# Altium schematic sheet Alimentation.SchDoc
size A4; SheetNumber: 2; SheetTotal: 5
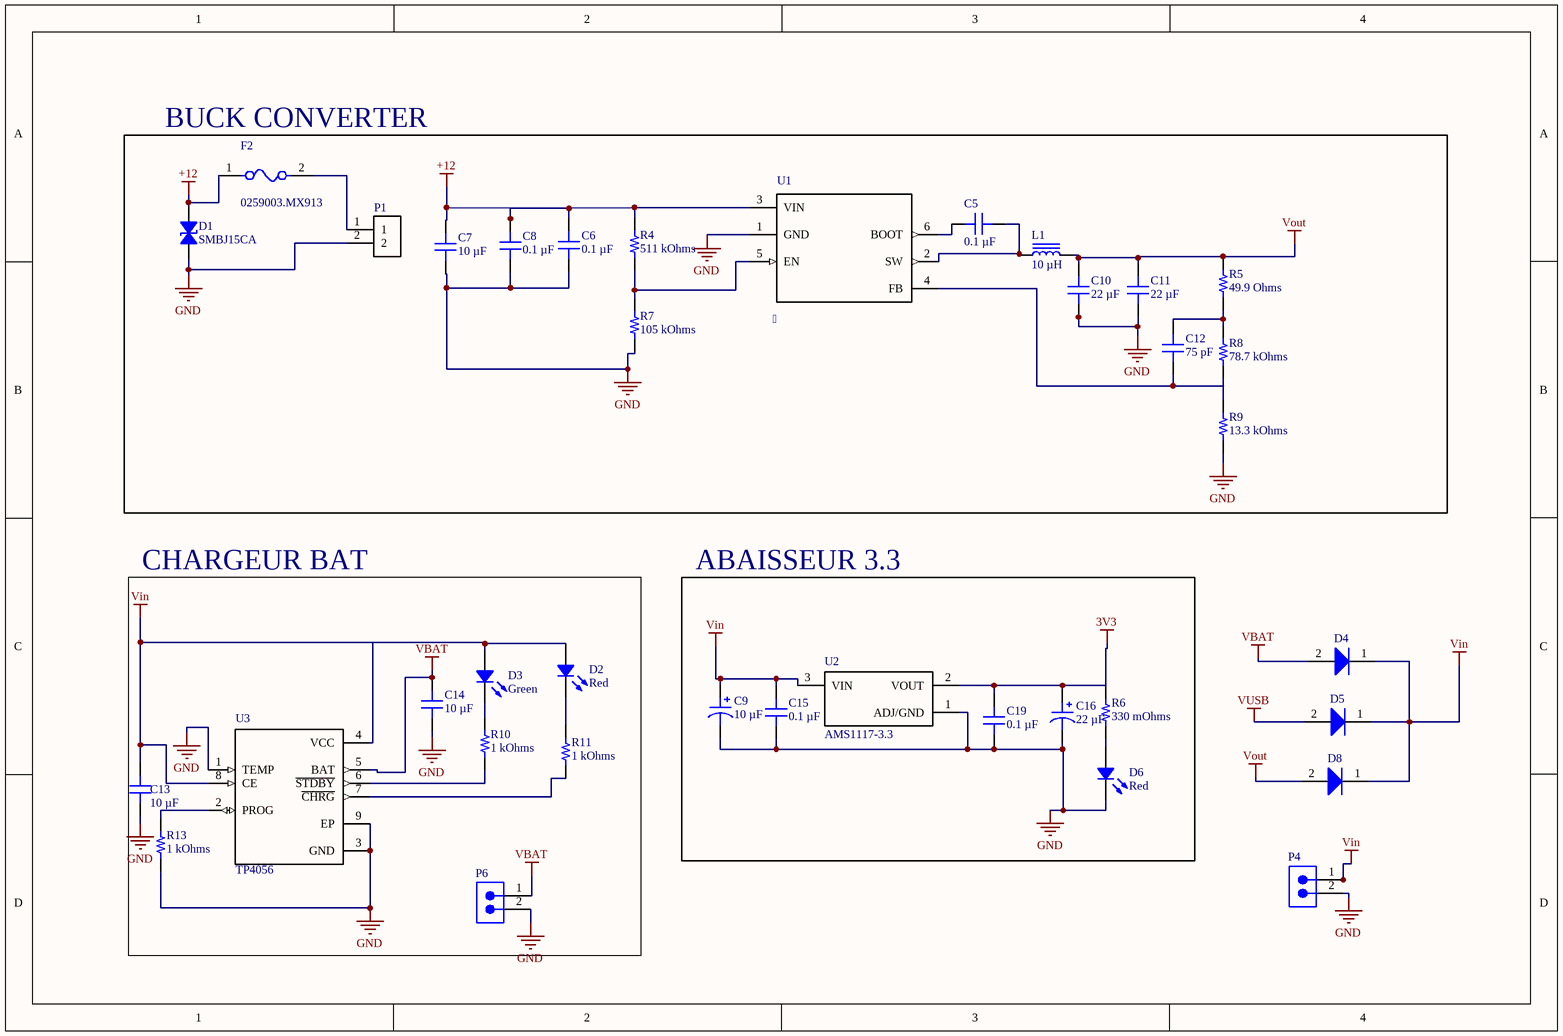
[diagram p0: Alimentation.SchDoc]

## Parts
C5  0.1 µF  [CAP 0402_1005]
C6  0.1 µF  [CAP 0402_1005]
C7  10 µF  [CAP 0805_2012]
C8  0.1 µF  [CAP 0402_1005]
C9  10 µF  [CAP ALSMD 4.3MM H5.4MM]
C10  22 µF  [CAP 0805_2012]
C11  22 µF  [CAP 0805_2012]
C12  75 pF  [CAP 0402_1005]
C13  10 µF  [CAP 0805_2012]
C14  10 µF  [CAP 0805_2012]
C15  0.1 µF  [CAP 0402_1005]
C16  22 µF  [CAP ALSMD 4.3MM H5.4MM]
C19  0.1 µF  [CAP 0402_1005]
D1  SMBJ15CA  [DO214AA SMB]
D2  Red  [LED 1206_3216 RED]
D3  Green  [LED 1206_3216 GREEN]
D4  NSR0320MW2T1G  [ONSC-SOD-323-2-477-02_V]  (value not drawn)
D5  NSR0320MW2T1G  [ONSC-SOD-323-2-477-02_V]  (value not drawn)
D6  Red  [LED 1206_3216 RED]
D8  NSR0320MW2T1G  [ONSC-SOD-323-2-477-02_V]  (value not drawn)
F2  0259003.MX913  [FP-0259-MFG]
L1  10 µH  [TDK VLS6045EX]
P1  282837-2  [*TE_282837-2]  (value not drawn)
P4  MTLW-102-05-G-S-172  [SMTC-MTLW-102-05-X-S-172]  (value not drawn)
P6  MTLW-102-05-G-S-172  [SMTC-MTLW-102-05-X-S-172]  (value not drawn)
R4  511 kOhms  [RES 0402_1005]
R5  49.9 Ohms  [RES 0402_1005]
R6  330 mOhms  [RES 0805_2012]
R7  105 kOhms  [RES 0402_1005]
R8  78.7 kOhms  [RES 0402_1005]
R9  13.3 kOhms  [RES 0402_1005]
R10  1 kOhms  [RES 0402_1005]
R11  1 kOhms  [RES 0402_1005]
R13  1 kOhms  [RES 0402_1005]
U1    [TPS54302DDCR]
U2  AMS1117-3.3  [AMS1117 3.3V]
U3  TP4056  [TP4056]

## Blocks framed on the sheet
CHARGEUR BAT: C13 C14 D2 D3 P6 R10 R11 R13 U3
ABAISSEUR 3.3: C9 C15 C16 C19 D6 R6 U2

## Nets
3V3: C16.1 C19.2 R6.2 U2.2(VOUT)
+12: C6.2 C7.2 C8.2 D1.1 F2.1 R4.2 U1.3(VIN)
GND: C6.1 C7.1 C8.1 C9.2 C10.1 C11.1 C13.1 C14.1 C15.1 C16.2 C19.1 D1.2 D6.2 P1.2 P4.2 P6.2 R7.1 R9.1 R13.1 U1.1(GND) U2.1(ADJ/GND) U3.1(TEMP) U3.3(GND) U3.9(EP)
VBAT: C14.2 D4.2(A) P6.1 U3.5(BAT)
Vin: C9.1 C13.2 C15.2 D2.1 D3.1 D4.1(K) D5.1(K) D8.1(K) P4.1 U2.3(VIN) U3.4(VCC) U3.8(CE)
Vout: C10.2 C11.2 D8.2(A) L1.2 R5.2
VUSB: D5.2(A)
NetC5_1: C5.1 U1.6(BOOT)
NetC5_2: C5.2 L1.1 U1.2(SW)
NetC12_1: C12.1 R5.1 R8.2
NetC12_2: C12.2 U1.4(FB)
NetD2_2: D2.2 R11.2
NetD3_2: D3.2 R10.2
NetD6_1: D6.1 R6.1
NetF2_2: F2.2 P1.1
NetR4_1: R4.1 R7.2 U1.5(EN)
NetR8_1: R8.1 R9.2
NetR10_1: R10.1 U3.6(~{STDBY})
NetR11_1: R11.1 U3.7(~{CHRG})
NetR13_2: R13.2 U3.2(PROG)

## Notes on the sheet
- (near F2) BUCK CONVERTER

## Library data of the parts
C5 C6 C8 C15 C19 = 885012105001: CAP CER 0.1UF 6.3V X5R 0402; manufacturer: Würth Elektronik; Tolerance: ±20%; Part Number: 885012105001; Capacitance: 0.1 µF; Applications: General Purpose; componentlink1description: Datasheet; componentlink1url: https://katalog.we-online.de/pbs/datasheet/885012105001.pdf; componentlink2description: DigiKey Link; componentlink2url: https://www.digikey.com/en/products/detail/würth-elektronik/885012105001/5453333; Device Package: 0402 (1005 Metric); lastupdated: 06/04/2026 7:11:10 PM; Lifecycle Status: Active; Minimum Order: 1; Mounting Type: Surface Mount, MLCC; Operating Temperature: -55°C ~ 85°C; Package / Case: 0402 (1005 Metric); packaging: TapeAndReel; partid: 1931; Part Status: Active; price: 0.01; series: WCAP-CSGP; Size / Dimension: 0.039" L x 0.020" W (1.00mm x 0.50mm); Supplier 1: DigiKey; Supplier Part Number 1: 732-7478-1-ND; Temperature Coefficient: X5R; Thickness (Max): 0.022" (0.55mm); value: 0.1 µF; Voltage - Rated: 6.3V
C7 C13 C14 = GMC21X7S106K6R3NT: CAP0805 X7S 10UF 10% 6.3V; manufacturer: Cal-Chip Electronics, Inc.; Part Number: GMC21X7S106K6R3NT; Capacitance: 10 µF; Applications: General Purpose; componentlink1description: Datasheet; componentlink1url: https://calchip.com/wp-content/uploads/2024/02/gmc_series-1.pdf; componentlink2description: DigiKey Link; componentlink2url: https://www.digikey.com/en/products/detail/cal-chip-electronics-inc/GMC21X7S106K6R3NT/25820663; Device Package: 0805 (2012 Metric); lastupdated: 06/04/2026 7:28:46 PM; Lifecycle Status: Active; Minimum Order: 1; Mounting Type: Surface Mount, MLCC; Operating Temperature: -55°C ~ 125°C; Package / Case: 0805 (2012 Metric); packaging: TapeAndReel; partid: 69922; price: 0.08; series: GMC; Size / Dimension: 0.079" L x 0.049" W (2.00mm x 1.25mm); Supplier 1: DigiKey; Supplier Part Number 1: 4713-GMC21X7S106K6R3NTCT-ND; Temperature Coefficient: X7S; Thickness (Max): 0.057" (1.45mm); Tolerance: ±10%; value: 10 µF; Voltage - Rated: 6.3V
C9 = UWX1C100MCL1GB: CAP ALUM 10UF 20% 16V SMD; manufacturer: Nichicon; Lifetime @ Temp.: 2000 Hrs @ 85°C; Polarization: Polar; Ripple Current @ High Frequency: 34.5 mA @ 10 kHz; Ripple Current @ Low Frequency: 23 mA @ 120 Hz; Surface Mount Land Size: 0.169" L x 0.169" W (4.30mm x 4.30mm); Part Number: UWX1C100MCL1GB; Applications: General Purpose; Capacitance: 10 µF; componentlink1description: Datasheet; componentlink1url: https://products.nichicon.co.jp/en/pdf/XJA043/e-uwx.pdf; componentlink2description: DigiKey Link; componentlink2url: https://www.digikey.com/en/products/detail/nichicon/UWX1C100MCL1GB/589841; Device Package: Radial, Can - SMD; Height - Seated (Max): 0.213" (5.40mm); lastupdated: 05/04/2026 8:29:53 PM; Lifecycle Status: Active; Minimum Order: 1; Mounting Type: Surface Mount; Operating Temperature: -40°C ~ 85°C; Package / Case: Radial, Can - SMD; packaging: TapeAndReel; partid: 7030; Part Status: Active; price: 0.06; series: UWX; Size / Dimension: 0.157" Dia (4.00mm); Supplier 1: DigiKey; Supplier Part Number 1: 493-2100-1-ND; Tolerance: ±20%; value: 10 µF; Voltage - Rated: 16 V
C10 C11 = 08056T226MAT2A: 0805 X7T 22UF20% 6.3V; manufacturer: KYOCERA AVX; Tolerance: ±20%; Part Number: 08056T226MAT2A; Capacitance: 22 µF; Applications: General Purpose; componentlink1description: Datasheet; componentlink1url: https://media.digikey.com/pdf/Data%20Sheets/AVX%20PDFs/CM03_CM05_CM105_CM21_CM316_Spec.pdf; componentlink2description: DigiKey Link; componentlink2url: https://www.digikey.com/en/products/detail/kyocera-avx/08056T226MAT2A/17866336; Device Package: 0805 (2012 Metric); lastupdated: 06/04/2026 7:30:15 PM; Lifecycle Status: Active; Minimum Order: 1; Mounting Type: Surface Mount, MLCC; Operating Temperature: -55°C ~ 125°C; Package / Case: 0805 (2012 Metric); packaging: TapeAndReel; partid: 54855; Part Status: Active; price: 0.09; series: CM; Size / Dimension: 0.079" L x 0.049" W (2.00mm x 1.25mm); Supplier 1: DigiKey; Supplier Part Number 1: 478-08056T226MAT2ACT-ND; Temperature Coefficient: X7T; Thickness (Max): 0.057" (1.45mm); value: 22 µF; Voltage - Rated: 6.3V
C12 = GMC04CG750F50NT: CAP0402 COG 75PF 1% 50V; manufacturer: Cal-Chip Electronics, Inc.; Temperature Coefficient: C0G, NP0; Part Number: GMC04CG750F50NT; Capacitance: 75 pF; Applications: General Purpose; componentlink1description: Datasheet; componentlink1url: https://calchip.com/wp-content/uploads/2023/09/GMC-Series-2.pdf; componentlink2description: DigiKey Link; componentlink2url: https://www.digikey.com/en/products/detail/cal-chip-electronics-inc/GMC04CG750F50NT/23028995; Device Package: 0402 (1005 Metric); lastupdated: 06/04/2026 7:07:09 PM; Lifecycle Status: Active; Minimum Order: 1; Mounting Type: Surface Mount, MLCC; Operating Temperature: -55°C ~ 125°C; Package / Case: 0402 (1005 Metric); packaging: TapeAndReel; partid: 62552; price: 0.01; series: GMC; Size / Dimension: 0.039" L x 0.020" W (1.00mm x 0.50mm); Supplier 1: DigiKey; Supplier Part Number 1: 4713-GMC04CG750F50NTCT-ND; Thickness (Max): 0.022" (0.55mm); Tolerance: ±1%; value: 75 pF; Voltage - Rated: 50V
C16 = EEE-0JA220SR: CAP ALUM 22UF 20% 6.3V SMD; manufacturer: Panasonic Electronic Components; Lifetime @ Temp.: 2000 Hrs @ 85°C; Polarization: Polar; Ripple Current @ High Frequency: 49.3 mA @ 10 kHz; Ripple Current @ Low Frequency: 29 mA @ 120 Hz; Surface Mount Land Size: 0.169" L x 0.169" W (4.30mm x 4.30mm); Part Number: EEE-0JA220SR; Applications: Automotive; Capacitance: 22 µF; componentlink1description: Datasheet; componentlink1url: //media.digikey.com/pdf/Data%20Sheets/Panasonic%20Electronic%20Components/S_Series,Type_V_Rev2018.pdf; componentlink2description: DigiKey Link; componentlink2url: https://www.digikey.com/en/products/detail/panasonic-electronic-components/EEE-0JA220SR/766025; Device Package: Radial, Can - SMD; Height - Seated (Max): 0.213" (5.40mm); lastupdated: 05/04/2026 8:29:53 PM; Lifecycle Status: Active; Minimum Order: 1; Mounting Type: Surface Mount; Operating Temperature: -40°C ~ 85°C; Package / Case: Radial, Can - SMD; packaging: TapeAndReel; partid: 7032; Part Status: Active; price: 0.09; Ratings: AEC-Q200; series: S; Size / Dimension: 0.157" Dia (4.00mm); Supplier 1: DigiKey; Supplier Part Number 1: PCE3857CT-ND; Tolerance: ±20%; value: 22 µF; Voltage - Rated: 6.3 V
D1 = SMBJ15CA: TVS DIODE 15VWM 24.4VC DO214AA; Manufacturer: Littelfuse Inc.; Bidirectional Channels: 1; Current - Peak Pulse (10/1000µs): 24.6A; Power Line Protection: No; Power - Peak Pulse: 600W; Type: Zener; Voltage - Breakdown (Min): 16.7V; Voltage - Clamping (Max) @ Ipp: 24.4V; Voltage - Reverse Standoff (Typ): 15V; Part Number: SMBJ15CA; Applications: General Purpose; ComponentLink1Description: Datasheet; ComponentLink1URL: https://www.littelfuse.com/~/media/electronics/datasheets/tvs_diodes/littelfuse_tvs_diode_smbj_datasheet.pdf.pdf; ComponentLink2Description: DigiKey Link; ComponentLink2URL: https://www.digikey.com/en/products/detail/littelfuse-inc/SMBJ15CA/285982; LastUpdated: 05/04/2026 9:01:04 PM; Lifecycle Status: Active; Minimum Order: 1; Mounting Type: Surface Mount; Operating Temperature: -65°C ~ 150°C (TJ); Package / Case: DO-214AA, SMB; Packaging: TapeAndReel; PartId: 9087; Part Status: Active; Price: 0.07; Series: SMBJ; Supplier 1: DigiKey; Supplier Part Number 1: SMBJ15CALFCT-ND; Supplier Device Package: DO-214AA (SMBJ)
D2 D6 = SML-LX1206SRC-TR: LED RED CLEAR 1206 SMD; Manufacturer: Lumex Opto/Components Inc.; Configuration: Standard; Current - Test: 20mA; Lens Color: Colorless; Lens Size: 2.00mm x 1.50mm; Lens Style: Rectangle with Flat Top; Millicandela Rating: 25mcd; Viewing Angle: 140°; Voltage - Forward (Vf) (Typ): 1.7V; Wavelength - Peak: 660nm; Part Number: SML-LX1206SRC-TR; Color: Red; ComponentLink1Description: Datasheet; ComponentLink1URL: //media.digikey.com/pdf/Data%20Sheets/Lumex%20PDFs/SML-LX1206SRC-TR.pdf; ComponentLink2Description: DigiKey Link; ComponentLink2URL: https://www.digikey.com/en/products/detail/lumex-opto-components-inc/SML-LX1206SRC-TR/229141; Device Package: 1206 (3216 Metric); Height (Max): 1.10mm; LastUpdated: 05/04/2026 8:39:22 PM; Lens Transparency: Clear; Lifecycle Status: Active; Minimum Order: 1; Mounting Type: Surface Mount; Package / Case: 1206 (3216 Metric); Packaging: TapeAndReel; PartId: 224; Part Status: Active; Price: 0.07; Series: -; Size / Dimension: 3.20mm L x 1.60mm W; Supplier 1: DigiKey; Supplier Part Number 1: 67-1359-1-ND; Supplier Device Package: 1206; Value: Red
D3 = IN-S126ATG: LED GREEN CLEAR 1206 SMD; Manufacturer: Inolux; Configuration: Standard; Current - Test: 20mA; Lens Color: Colorless; Lens Size: 2.00mm x 1.50mm; Lens Style: Rectangle with Flat Top; Millicandela Rating: 560mcd; Viewing Angle: 120°; Voltage - Forward (Vf) (Typ): 3.2V; Wavelength - Dominant: 520nm; Wavelength - Peak: 526nm; Part Number: IN-S126ATG; Color: Green; ComponentLink1Description: Datasheet; ComponentLink1URL: http://www.inolux-corp.com/datasheet/SMDLED/Mono%20Color%20Top%20View/IN-S126AT%20Series_V1.0.pdf; ComponentLink2Description: DigiKey Link; ComponentLink2URL: https://www.digikey.com/en/products/detail/inolux/IN-S126ATG/7604905; Device Package: 1206 (3216 Metric); Height (Max): 1.10mm; LastUpdated: 05/04/2026 8:37:03 PM; Lens Transparency: Clear; Lifecycle Status: Active; Minimum Order: 1; Mounting Type: Surface Mount; Package / Case: 1206 (3216 Metric); Packaging: TapeAndReel; PartId: 552; Part Status: Active; Price: 0.06; Series: IN-S126AT; Size / Dimension: 3.20mm L x 1.50mm W; Supplier 1: DigiKey; Supplier Part Number 1: 1830-1089-1-ND; Supplier Device Package: 1206; Value: Green
D4 D5 D8 = CMP-1055-00466-1: Schottky Barrier Diode, 2-Pin SOD-323, Pb-Free, Tape and Reel; Manufacturer: On Semiconductor; Configuration: Single; IFSM Max (A): 5; Mounting Technology: Surface Mount; Packing: Tape and Reel; PackageDescription: 2-Pin SOD, Body 1.7 x 1.25 mm; ComponentLink3Description: Package Specification; PartNumber: NSR0320MW2T1G; ComponentLink1URL: http://www.onsemi.com/; PackageReference: SOD-323-2-477-02; RoHS: TRUE; PackageVersion: Rev. H, 03/2007; DatasheetVersion: Rev. 4; ComponentLink1Description: Manufacturer URL; ComponentLink3URL: http://www.onsemi.com/pub_link/Collateral/477-02.PDF.1; ComponentLink2Description: Datasheet; ComponentLink2URL: http://www.onsemi.cn/pub_link/Collateral/NSR0320MW2T1-D.PDF
F2 = CMP-08605-000087-1: FUSE BRD MNT 3A 125VAC/VDC RAD; Approvals: UR; DC Cold Resistance: 275mR; Voltage Rating (AC): 125V; Type: Electrical; Mount: Through Hole; Length: 0.512inch; Min Operating Temperature: -55°C; Packaging: Bulk; Current Rating: 3A; Width: 8mm; Package Quantity: 1000; Height: 8mm; Termination: Radial; RoHS Compliant: Yes; Series: PICO® 259-UL913; Case/Package: Radial; Voltage Rating (DC): 125V; REACH SVHC: No SVHC; Resistance: 275mR; Fuse Current: 3A; Max Operating Temperature: 90°C
L1 = VLS6045EX-100M: FIXED IND 10UH 3.4A 61 MOHM SMD; Manufacturer: TDK Corporation; Current - Saturation: 3.9A; DC Resistance (DCR): 47mOhm; Inductance Frequency - Test: 100 kHz; Material - Core: Ferrite; Shielding: Shielded; Tolerance: ±20%; Type: Drum Core, Wirewound; Part Number: VLS6045EX-100M; ComponentLink1Description: Datasheet; ComponentLink1URL: https://product.tdk.com/info/en/catalog/datasheets/inductor_commercial_power_vls6045ex_en.pdf?ref_disty=digikey; ComponentLink2Description: DigiKey Link; ComponentLink2URL: https://www.digikey.com/en/products/detail/tdk-corporation/VLS6045EX-100M/5057822; Current Rating (Amps): 3.4 A; Device Package: Nonstandard; Height - Seated (Max): 0.177" (4.50mm); Inductance: 10 µH; LastUpdated: 20/05/2026 2:30:18 PM; Lifecycle Status: Active; Minimum Order: 1; Mounting Type: Surface Mount; Operating Temperature: -40°C ~ 105°C; Package / Case: Nonstandard; Packaging: TapeAndReel; PartId: 8938; Part Status: Active; Price: 0.14; Series: VLS-EX; Size / Dimension: 0.236" L x 0.236" W (6.00mm x 6.00mm); Supplier 1: DigiKey; Supplier Part Number 1: 445-173039-1-ND; Value: 10 µH
P1 = Bornier 2 vis 5.08mm: Terminal Block Connector Wire Receptacle 2 5.08 mm 30-16 AWG Green 13.5 A 250 V | TE Connectivity 282837-2; MF: TE Connectivity; Package: None; Price: None; Check_prices: https://www.snapeda.com/parts/282837-2/TE+Connectivity+AMP+Connectors/view-part/?ref=eda; SnapEDA_Link: https://www.snapeda.com/parts/282837-2/TE+Connectivity+AMP+Connectors/view-part/?ref=snap; MP: 282837-2; Availability: In Stock; Purchase-URL: https://www.snapeda.com/api/url_track_click_mouser/?unipart_id=2549980&manufacturer=TE Connectivity&part_name=282837-2&search_term=bornier 2 vis 5.08mm; Value: *
P4 P6 = CMP-1024-00064-1: Low Profile .025" SQ Post Header, Through-hole, Vertical, -55 to 125 degC, 2.54 mm Pitch, 2-Pin, Male, RoHS; Manufacturer: Samtec; Pitch: 2.54 mm; ComponentLink2URL: http://www.samtec.com/documents/webfiles/pdf/MTLW_TH.PDF; PackageDescription: Low Profile Terminal Assembly; ComponentLink3URL: http://www.samtec.com/documents/webfiles/cpdf/MTLW-1XX-XX-XX-X-XXX-XX-XX-MKT1.pdf; PackageReference: MTLW-102-05-X-S-172; Mounting Technology: Through-hole; ComponentLink2Description: Datasheet; PackageVersion: T, 6/1991; Orientation: Vertical; DatasheetVersion: F-214; RoHS: True; ComponentLink3Description: Package Specification; ComponentLink1URL: http://www.samtec.com; Temperature Range: -55 to 125 degC; PartNumber: MTLW-102-05-G-S-172; ComponentLink1Description: Manufacturer URL
R4 = CPF0402B511KE1: CPF 0402 511K 0.1% 25PPM 1K RL; Manufacturer: TE Connectivity Passive Product; Power (Watts): 0.063W, 1/16W; Temperature Coefficient: ±25ppm/°C; Part Number: CPF0402B511KE1; Value: 511 kOhms; ComponentLink1Description: Datasheet; ComponentLink1URL: https://www.te.com/commerce/DocumentDelivery/DDEController?Action=srchrtrv&DocNm=1773200&DocType=DS&DocLang=English; ComponentLink2Description: DigiKey Link; ComponentLink2URL: https://www.digikey.com/en/products/detail/te-connectivity-passive-product/CPF0402B511KE1/14007317; Composition: Thin Film; Device Package: 0402 (1005 Metric); Height - Seated (Max): 0.014" (0.35mm); LastUpdated: 09/02/2024 8:29:08 PM; Lifecycle Status: Active; Minimum Order: 1; Number of Terminations: 2; Operating Temperature: -55°C ~ 155°C; Package / Case: 0402 (1005 Metric); Packaging: TapeAndReel; PartId: 60347; Part Status: Active; Price: 0.13; Resistance: 511 kOhms; Series: CPF; Size / Dimension: 0.039" L x 0.020" W (1.00mm x 0.50mm); Supplier 1: DigiKey; Supplier Part Number 1: 1712-CPF0402B511KE1CT-ND; Supplier Device Package: 0402; Tolerance: ±0.1%
R5 = RG1005N-49R9-W-T1: RES SMD 49.9OHM 0.05% 1/16W 0402; Manufacturer: Susumu; Power (Watts): 0.063W, 1/16W; Temperature Coefficient: ±10ppm/°C; Part Number: RG1005N-49R9-W-T1; Value: 49.9 Ohms; ComponentLink1Description: Datasheet; ComponentLink1URL: https://mm.digikey.com/Volume0/opasdata/d220001/medias/docus/1162/RG_RM_RGH_Oct2012.pdf; ComponentLink2Description: DigiKey Link; ComponentLink2URL: https://www.digikey.com/en/products/detail/susumu/RG1005N-49R9-W-T1/1251533; Composition: Thin Film; Device Package: 0402 (1005 Metric); Features: Anti-Sulfur, Automotive AEC-Q200; Height - Seated (Max): 0.016" (0.40mm); LastUpdated: 09/02/2024 8:28:25 PM; Lifecycle Status: Active; Minimum Order: 1; Number of Terminations: 2; Operating Temperature: -55°C ~ 155°C; Package / Case: 0402 (1005 Metric); Packaging: TapeAndReel; PartId: 81673; Price: 0.41; Ratings: AEC-Q200; Resistance: 49.9 Ohms; Series: RG; Size / Dimension: 0.039" L x 0.020" W (1.00mm x 0.50mm); Supplier 1: DigiKey; Supplier Part Number 1: 408-RG1005N-49R9-W-T1CT-ND; Supplier Device Package: 0402; Tolerance: ±0.05%
R6 = RL1220S-R33-F: RES 0.33 OHM 1% 1/3W 0805; Manufacturer: Susumu; Power (Watts): 0.333W, 1/3W; Temperature Coefficient: 0/ +200ppm/°C; Part Number: RL1220S-R33-F; Value: 330 mOhms; ComponentLink1Description: Datasheet; ComponentLink1URL: http://www.susumu.co.jp/common/pdf/n_catalog_partition08_en.pdf; ComponentLink2Description: DigiKey Link; ComponentLink2URL: https://www.digikey.com/en/products/detail/susumu/RL1220S-R33-F/432488; Composition: Thin Film; Device Package: 0805 (2012 Metric); Features: Current Sense; Height - Seated (Max): 0.020" (0.50mm); LastUpdated: 05/04/2026 8:11:25 PM; Lifecycle Status: Active; Minimum Order: 1; Number of Terminations: 2; Operating Temperature: -55°C ~ 125°C; Package / Case: 0805 (2012 Metric); Packaging: TapeAndReel; PartId: 28048; Part Status: Active; Price: 0.03; Resistance: 330 mOhms; Series: RL; Size / Dimension: 0.079" L x 0.049" W (2.00mm x 1.25mm); Supplier 1: DigiKey; Supplier Part Number 1: RL12S.33FCT-ND; Supplier Device Package: 0805; Tolerance: ±1%
R7 = CPF0402B105KE1: RES 105 KOHM 0.1% 1/16W 0402; Manufacturer: TE Connectivity Passive Product; Power (Watts): 0.063W, 1/16W; Temperature Coefficient: ±25ppm/°C; Part Number: CPF0402B105KE1; Value: 105 kOhms; ComponentLink2Description: DigiKey Link; ComponentLink2URL: https://www.digikey.com/en/products/detail/te-connectivity-passive-product/CPF0402B105KE1/7493534; Composition: Thin Film; Device Package: 0402 (1005 Metric); Height - Seated (Max): 0.014" (0.35mm); LastUpdated: 09/02/2024 8:28:39 PM; Lifecycle Status: Active; Minimum Order: 1; Number of Terminations: 2; Operating Temperature: -55°C ~ 155°C; Package / Case: 0402 (1005 Metric); Packaging: TapeAndReel; PartId: 75075; Part Status: Active; Price: 0.14; Resistance: 105 kOhms; Series: CPF, Neohm; Size / Dimension: 0.039" L x 0.020" W (1.00mm x 0.50mm); Supplier 1: DigiKey; Supplier Part Number 1: 1712-CPF0402B105KE1CT-ND; Supplier Device Package: 0402; Tolerance: ±0.1%
R8 = RCG040278K7FKED: RCG0402 100 78K7 1% ED; Manufacturer: Vishay Dale; Power (Watts): 0.063W, 1/16W; Temperature Coefficient: ±100ppm/°C; Part Number: RCG040278K7FKED; Value: 78.7 kOhms; ComponentLink1Description: Datasheet; ComponentLink1URL: https://www.vishay.com/docs/20047/rcge3.pdf; ComponentLink2Description: DigiKey Link; ComponentLink2URL: https://www.digikey.com/en/products/detail/vishay-dale/RCG040278K7FKED/13212793; Composition: Thick Film; Device Package: 0402 (1005 Metric); Height - Seated (Max): 0.016" (0.40mm); LastUpdated: 09/02/2024 8:28:55 PM; Lifecycle Status: Active; Minimum Order: 1; Number of Terminations: 2; Operating Temperature: -55°C ~ 155°C; Package / Case: 0402 (1005 Metric); Packaging: TapeAndReel; PartId: 64828; Part Status: Active; Price: 0.01; Resistance: 78.7 kOhms; Series: RCG e3; Size / Dimension: 0.039" L x 0.020" W (1.00mm x 0.50mm); Supplier 1: DigiKey; Supplier Part Number 1: 541-RCG040278K7FKEDCT-ND; Supplier Device Package: 0402; Tolerance: ±1%
R9 = RQ73C1E13K3BTD: RES 13.3 KOHMS 0.1% 1/16W 0402; Manufacturer: TE Connectivity Passive Product; Power (Watts): 0.063W, 1/16W; Temperature Coefficient: ±10ppm/°C; Part Number: RQ73C1E13K3BTD; Value: 13.3 kOhms; ComponentLink1Description: Datasheet; ComponentLink1URL: //media.digikey.com/pdf/Data%20Sheets/Tyco%20Electronics%20P%20B%20PDFs/RQ73-0618%20v2.pdf; ComponentLink2Description: DigiKey Link; ComponentLink2URL: https://www.digikey.com/en/products/detail/te-connectivity-passive-product/RQ73C1E13K3BTD/9480068; Composition: Thin Film; Device Package: 0402 (1005 Metric); Features: Anti-Sulfur, Automotive AEC-Q200; Height - Seated (Max): 0.016" (0.40mm); LastUpdated: 09/02/2024 8:29:13 PM; Lifecycle Status: Active; Minimum Order: 1; Number of Terminations: 2; Operating Temperature: -55°C ~ 155°C; Package / Case: 0402 (1005 Metric); Packaging: TapeAndReel; PartId: 21943; Part Status: Active; Price: 0.27; Ratings: AEC-Q200; Resistance: 13.3 kOhms; Series: RQ73; Size / Dimension: 0.039" L x 0.020" W (1.00mm x 0.50mm); Supplier 1: DigiKey; Supplier Part Number 1: A140120CT-ND; Supplier Device Package: 0402; Tolerance: ±0.1%
R10 R11 R13 = TNPU04021K00BZEP00: TNPU0402 1K0 0.1% T-16 EP1 E3; Manufacturer: Vishay Dale; Power (Watts): 0.063W, 1/16W; Temperature Coefficient: ±5ppm/°C; Part Number: TNPU04021K00BZEP00; Value: 1 kOhms; ComponentLink1Description: Datasheet; ComponentLink1URL: http://www.vishay.com/docs/28779/tnpue3.pdf; ComponentLink2Description: DigiKey Link; ComponentLink2URL: https://www.digikey.com/en/products/detail/vishay-dale/TNPU04021K00BZEP00/10668523; Composition: Thin Film; Device Package: 0402 (1005 Metric); Features: Anti-Sulfur, Automotive AEC-Q200, Moisture Resistant; Height - Seated (Max): 0.016" (0.40mm); LastUpdated: 09/02/2024 8:29:39 PM; Lifecycle Status: Active; Minimum Order: 1; Number of Terminations: 2; Operating Temperature: -55°C ~ 125°C; Package / Case: 0402 (1005 Metric); Packaging: TapeAndReel; PartId: 49940; Part Status: Active; Price: 0.67; Ratings: AEC-Q200; Resistance: 1 kOhms; Series: TNPU e3; Size / Dimension: 0.039" L x 0.020" W (1.00mm x 0.50mm); Supplier 1: DigiKey; Supplier Part Number 1: 541-TNPU04021K00BZEP00CT-ND; Supplier Device Package: 0402; Tolerance: ±0.1%
U1 = TPS54302DDCR_1: 4.5-V to 28-V Input, 3-A Output, EMI Friendly Synchronous Step-Down Converter; MF: Texas Instruments; Package: SOT-23-THN-6 Texas Instruments; Price: None; SnapEDA_Link: https://www.snapeda.com/parts/TPS54302DDCR/Texas+Instruments/view-part/?ref=snap; MP: TPS54302DDCR; Availability: In Stock; Check_prices: https://www.snapeda.com/parts/TPS54302DDCR/Texas+Instruments/view-part/?ref=eda; Value: *
U2 = AMS1117-3.3: Linear Voltage Regulator IC Positive Fixed 1 Output 1A SOT-223-3L; MF: UMW; Package: SOT-223-3L UMW; Price: None; SnapEDA_Link: https://www.snapeda.com/parts/AMS1117-3.3/UMW/view-part/?ref=snap; MP: AMS1117-3.3; Availability: In Stock; Check_prices: https://www.snapeda.com/parts/AMS1117-3.3/UMW/view-part/?ref=eda; Value: *
U3 = TP4056: Complete single cell Li-Ion battery with a constant current / constant voltage linear charger; MF: NanJing Top Power ASIC Corp.; Package: Package; Price: None; SnapEDA_Link: https://www.snapeda.com/parts/TP4056/NanJing+Top+Power+ASIC+Corp./view-part/?ref=snap; MP: TP4056; Availability: Not in stock; Check_prices: https://www.snapeda.com/parts/TP4056/NanJing+Top+Power+ASIC+Corp./view-part/?ref=eda; Value: *